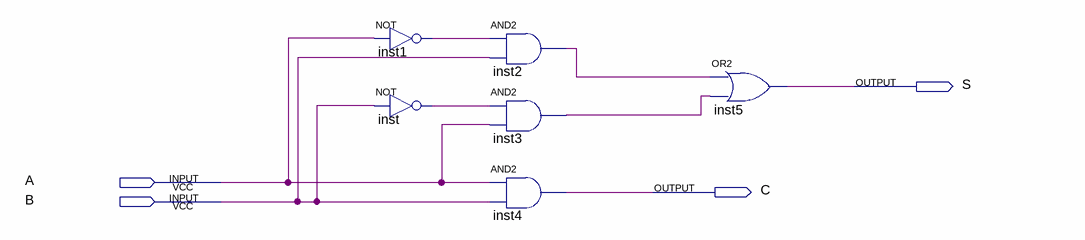
[diagram p0: schematic sheet]
// Quartus schematic Half_adder.bdf as structural Verilog: 6 symbols, 4 pins
module Half_adder (
  input  A,
  input  B,
  output S,
  output C
);

  wire inst1_out, inst2_out, inst3_out, inst_out;

  not inst1 (inst1_out, A);
  not inst (inst_out, B);
  and inst2 (inst2_out, inst1_out, B);
  and inst3 (inst3_out, inst_out, A);
  and inst4 (C, A, B);
  or inst5 (S, inst2_out, inst3_out);
endmodule
